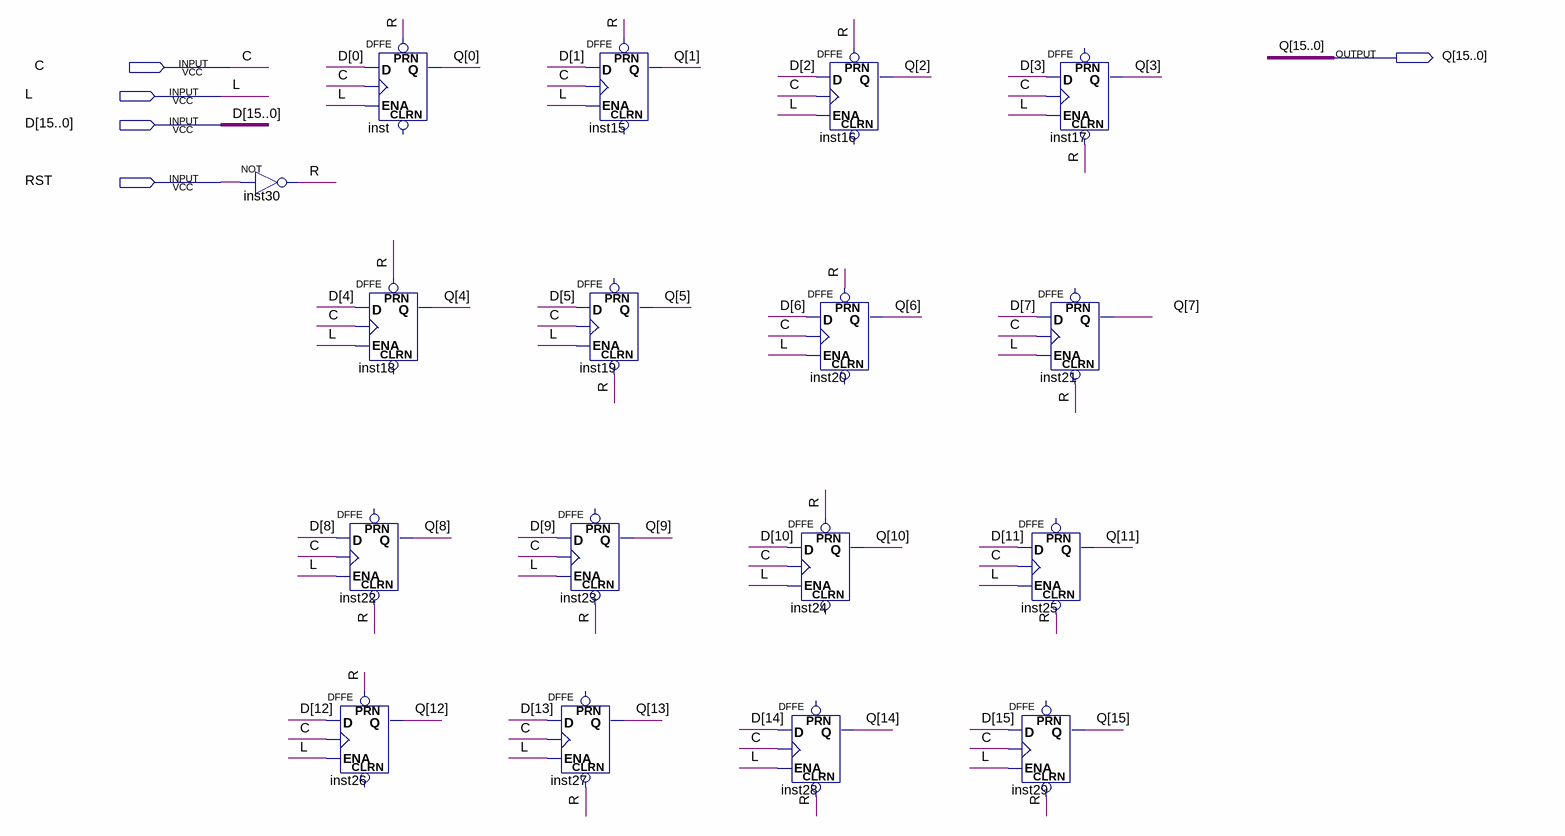
[diagram p0: schematic sheet]
// Quartus schematic SpeeREG.bdf as structural Verilog: 17 symbols, 5 pins
module SpeeREG (
  input  C,
  input  L,
  input  [15:0] D,
  input  RST,
  output [15:0] Q
);

  wire R;

  not inst30 (R, RST);
  DFFE inst26 (.PRN(R), .D(D[12]), .CLK(C), .ENA(L), .Q(Q[12]));  // open: CLRN
  DFFE inst (.PRN(R), .D(D[0]), .CLK(C), .ENA(L), .Q(Q[0]));  // open: CLRN
  DFFE inst18 (.PRN(R), .D(D[4]), .CLK(C), .ENA(L), .Q(Q[4]));  // open: CLRN
  DFFE inst22 (.CLRN(R), .D(D[8]), .CLK(C), .ENA(L), .Q(Q[8]));  // open: PRN
  DFFE inst23 (.CLRN(R), .D(D[9]), .CLK(C), .ENA(L), .Q(Q[9]));  // open: PRN
  DFFE inst27 (.CLRN(R), .D(D[13]), .CLK(C), .ENA(L), .Q(Q[13]));  // open: PRN
  DFFE inst15 (.PRN(R), .D(D[1]), .CLK(C), .ENA(L), .Q(Q[1]));  // open: CLRN
  DFFE inst19 (.CLRN(R), .D(D[5]), .CLK(C), .ENA(L), .Q(Q[5]));  // open: PRN
  DFFE inst24 (.PRN(R), .D(D[10]), .CLK(C), .ENA(L), .Q(Q[10]));  // open: CLRN
  DFFE inst28 (.CLRN(R), .D(D[14]), .CLK(C), .ENA(L), .Q(Q[14]));  // open: PRN
  DFFE inst16 (.PRN(R), .D(D[2]), .CLK(C), .ENA(L), .Q(Q[2]));  // open: CLRN
  DFFE inst20 (.PRN(R), .D(D[6]), .CLK(C), .ENA(L), .Q(Q[6]));  // open: CLRN
  DFFE inst25 (.CLRN(R), .D(D[11]), .CLK(C), .ENA(L), .Q(Q[11]));  // open: PRN
  DFFE inst29 (.CLRN(R), .D(D[15]), .CLK(C), .ENA(L), .Q(Q[15]));  // open: PRN
  DFFE inst17 (.CLRN(R), .D(D[3]), .CLK(C), .ENA(L), .Q(Q[3]));  // open: PRN
  DFFE inst21 (.CLRN(R), .D(D[7]), .CLK(C), .ENA(L), .Q(Q[7]));  // open: PRN
endmodule
